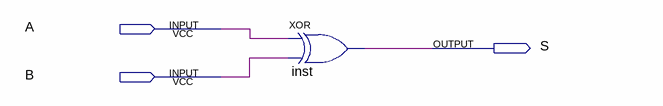
[diagram p0: schematic sheet]
// Quartus schematic portaXOR.bdf as structural Verilog: 1 symbols, 3 pins
module portaXOR (
  input  A,
  input  B,
  output S
);

  xor inst (S, A, B);
endmodule
